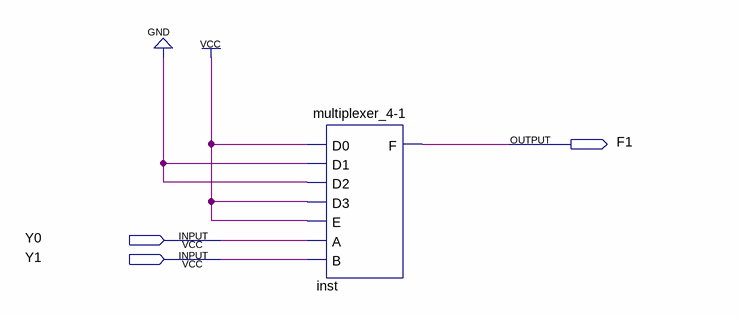
[diagram p0: schematic sheet]
// Quartus schematic NXOR.bdf as structural Verilog: 1 symbols, 3 pins
module NXOR (
  input  Y0,
  input  Y1,
  output F1
);

  \multiplexer_4-1  inst (.D0(1'b1), .D1(1'b0), .D2(1'b0), .D3(1'b1), .E(1'b1), .A(Y0), .B(Y1), .F(F1));
endmodule
